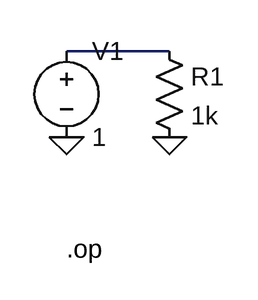
[diagram p0: schematic label_on_nothing_absent.asc]
label_on_nothing_absent.asc, the LTspice schematic file:
Version 4
SHEET 1 880 680
WIRE 0 16 96 16
FLAG 0 96 0
FLAG 96 96 0
SYMBOL voltage 0 0 R0
SYMATTR InstName V1
SYMATTR Value 1
SYMBOL res 80 0 R0
SYMATTR InstName R1
SYMATTR Value 1k
TEXT 0 200 Left 2 !.op

The netlist it stands for:
* label_on_nothing_absent.asc
V1 N001 0 1
R1 N001 0 1k
.op
.backanno
.end